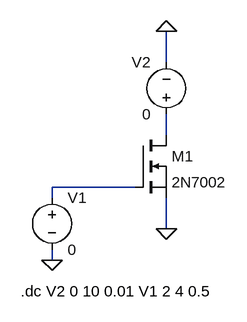
[diagram p0: schematic CurvasCaracteristicas2N7000.asc]
CurvasCaracteristicas2N7000.asc, the LTspice schematic file:
Version 4.1
SHEET 1 880 680
WIRE 192 -32 192 -80
WIRE 192 80 192 48
WIRE 144 160 16 160
WIRE 16 176 16 160
WIRE 192 224 192 176
WIRE 16 272 16 256
FLAG 192 224 0
FLAG 192 -80 0
FLAG 16 272 0
SYMBOL nmos 144 80 R0
SYMATTR InstName M1
SYMATTR Value 2N7002
SYMBOL voltage 16 160 R0
SYMATTR InstName V1
SYMATTR Value 0
SYMBOL voltage 192 64 R180
WINDOW 0 24 96 Left 2
WINDOW 3 24 16 Left 2
SYMATTR InstName V2
SYMATTR Value 0
TEXT -32 320 Left 2 !.dc V2 0 10 0.01 V1 2 4 0.5

The netlist it stands for:
* CurvasCaracteristicas2N7000.asc
M1 N001 N002 0 0 2N7002
V1 N002 0 0
V2 N001 0 0
.model NMOS NMOS
.model PMOS PMOS
.lib standard.mos
.dc V2 0 10 0.01 V1 2 4 0.5
.backanno
.end